# Altium schematic sheet Port_Expanders.SchDoc
size A; SheetNumber: 6; SheetTotal: 6
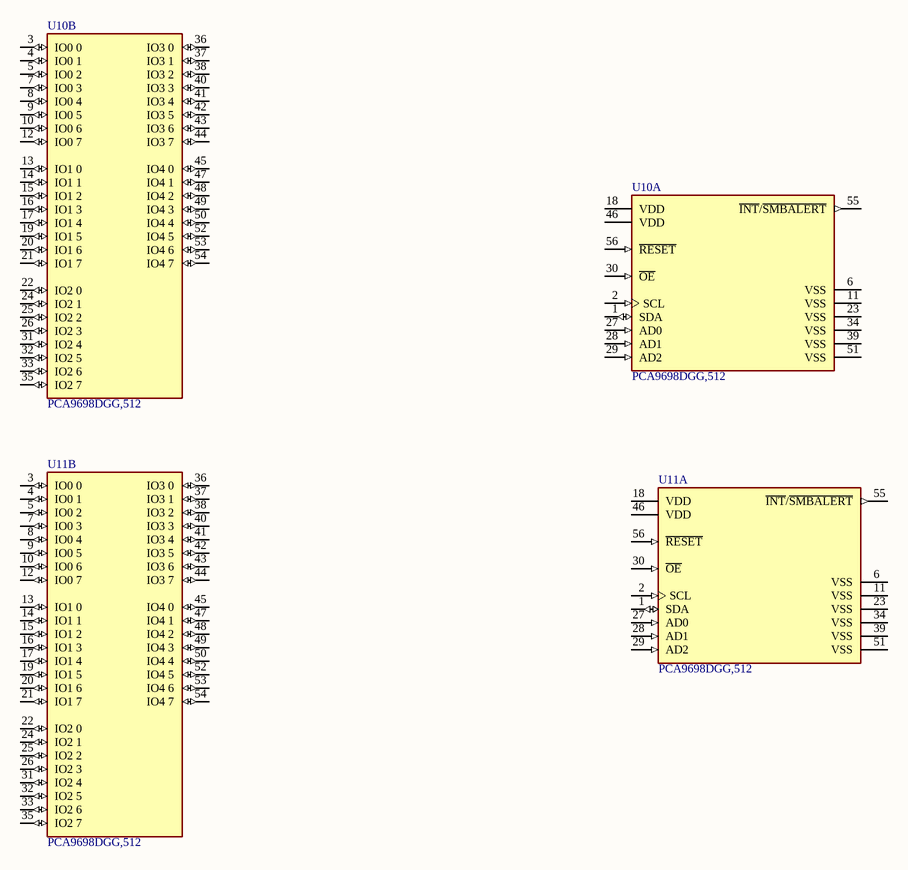
[diagram p0: Port_Expanders.SchDoc]

## Parts
U10  PCA9698DGG,512  [FP-SOT364-1-MFG]  (parts A,B of 2)
U11  PCA9698DGG,512  [FP-SOT364-1-MFG]  (parts A,B of 2)

## Nets

Not connected (* = marked no-connect by the designer): U10 1(SDA) 2(SCL) 3(IO0_0) 4(IO0_1) 5(IO0_2) 6(VSS) 7(IO0_3) 8(IO0_4) 9(IO0_5) 10(IO0_6) 11(VSS) 12(IO0_7) 13(IO1_0) 14(IO1_1) 15(IO1_2) 16(IO1_3) 17(IO1_4) 18(VDD) 19(IO1_5) 20(IO1_6) 21(IO1_7) 22(IO2_0) 23(VSS) 24(IO2_1) 25(IO2_2) 26(IO2_3) 27(AD0) 28(AD1) 29(AD2) 30(~{OE}) 31(IO2_4) 32(IO2_5) 33(IO2_6) 34(VSS) 35(IO2_7) 36(IO3_0) 37(IO3_1) 38(IO3_2) 39(VSS) 40(IO3_3) 41(IO3_4) 42(IO3_5) 43(IO3_6) 44(IO3_7) 45(IO4_0) 46(VDD) 47(IO4_1) 48(IO4_2) 49(IO4_3) 50(IO4_4) 51(VSS) 52(IO4_5) 53(IO4_6) 54(IO4_7) 55(~{INT}/~{SMBALERT}) 56(~{RESET}); U11 1(SDA) 2(SCL) 3(IO0_0) 4(IO0_1) 5(IO0_2) 6(VSS) 7(IO0_3) 8(IO0_4) 9(IO0_5) 10(IO0_6) 11(VSS) 12(IO0_7) 13(IO1_0) 14(IO1_1) 15(IO1_2) 16(IO1_3) 17(IO1_4) 18(VDD) 19(IO1_5) 20(IO1_6) 21(IO1_7) 22(IO2_0) 23(VSS) 24(IO2_1) 25(IO2_2) 26(IO2_3) 27(AD0) 28(AD1) 29(AD2) 30(~{OE}) 31(IO2_4) 32(IO2_5) 33(IO2_6) 34(VSS) 35(IO2_7) 36(IO3_0) 37(IO3_1) 38(IO3_2) 39(VSS) 40(IO3_3) 41(IO3_4) 42(IO3_5) 43(IO3_6) 44(IO3_7) 45(IO4_0) 46(VDD) 47(IO4_1) 48(IO4_2) 49(IO4_3) 50(IO4_4) 51(VSS) 52(IO4_5) 53(IO4_6) 54(IO4_7) 55(~{INT}/~{SMBALERT}) 56(~{RESET})

## Library data of the parts
U10 U11 = CMP-10112-000033-1: IC I/O EXPANDER I2C 40B 56TSSOP; Max Supply Voltage: 5.5V; Max Frequency: 1MHz; Output Current: 50mA; Nominal Supply Current: 100mA; Min Supply Voltage: 2.3V; Number of I/Os: 40; Max Power Dissipation: 500mW; Case/Package: TSSOP; Packaging: Rail/Tube; Package Quantity: 35; Interface: I2C; Frequency: 1MHz; Series: -; Supply Voltage-Nom: 5.5V; Min Operating Temperature: -40°C; Mount: Surface Mount; Weight: 0.026103oz; Supply Current: 100mA; Radiation Hardening: No; Number of Pins: 56; Max Operating Temperature: 85°C; Lead Free: Lead Free